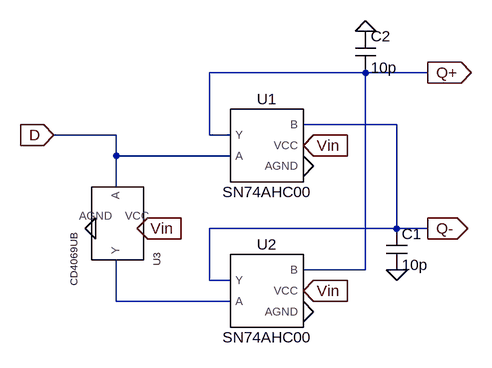
[diagram p0: schematic Exp5_non_overlap_generator.asc]
Exp5_non_overlap_generator.asc, the LTspice schematic file:
Version 4.1
SHEET 1 880 680
WIRE 208 -48 -32 -48
WIRE 304 -48 208 -48
WIRE 256 32 112 32
WIRE -176 48 -272 48
WIRE -32 48 -32 -48
WIRE 0 48 -32 48
WIRE -176 80 -176 48
WIRE 0 80 -176 80
WIRE -176 128 -176 80
WIRE 256 192 256 32
WIRE 256 192 -32 192
WIRE 304 192 256 192
WIRE 208 256 208 -48
WIRE 208 256 112 256
WIRE -32 272 -32 192
WIRE 0 272 -32 272
WIRE -176 304 -176 240
WIRE 0 304 -176 304
FLAG 208 -112 0
FLAG 256 256 0
FLAG 112 320 0
FLAG 112 96 0
FLAG -208 192 0
FLAG -272 48 D
IOPIN -272 48 In
FLAG -144 192 Vin
IOPIN -144 192 In
FLAG 304 -48 Q+
IOPIN 304 -48 Out
FLAG 304 192 Q-
IOPIN 304 192 Out
FLAG 112 64 Vin
IOPIN 112 64 In
FLAG 112 288 Vin
IOPIN 112 288 In
SYMBOL SN74AHC00 48 64 R0
SYMATTR InstName U1
SYMBOL SN74AHC00 48 288 R0
SYMATTR InstName U2
SYMBOL CD4069UB -176 176 R90
SYMATTR InstName U3
SYMBOL cap 240 192 R0
SYMATTR InstName C1
SYMATTR Value 10p
SYMBOL cap 192 -112 R0
SYMATTR InstName C2
SYMATTR Value 10p

The netlist it stands for:
* Exp5_non_overlap_generator.asc
X§U1 Q+ D Q- Vin 0 SN74AHC00  ; pins Y A B VCC AGND
X§U2 Q- N001 Q+ Vin 0 SN74AHC00  ; pins Y A B VCC AGND
X§U3 N001 D Vin 0 CD4069UB  ; pins Y A VCC AGND
C1 Q- 0 10p
C2 0 Q+ 10p
.lib C:\Users\Saravanan\OneDrive\Documents\LTspice\SN74AHC00.cir
.lib C:\Users\Saravanan\OneDrive\Documents\LTspice\CD4069UB.cir
.backanno
.end